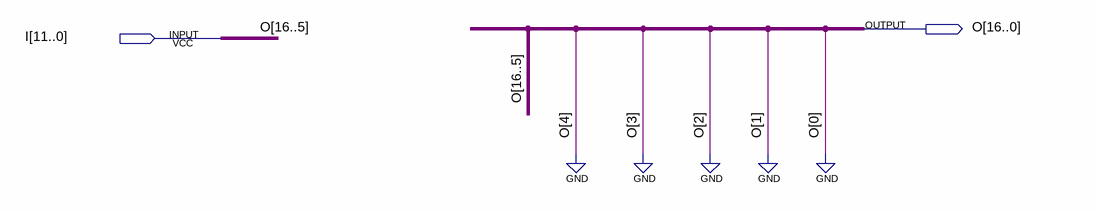
[diagram p0: schematic sheet]
// Quartus schematic mult5.bdf as structural Verilog: 0 symbols, 2 pins
module mult5 (
  input  [11:0] I,
  output [16:0] O
);


  assign O = {I, {5{1'b0}}};
endmodule
